# EAGLE design source_eagle (EAGLE 9.6.2)
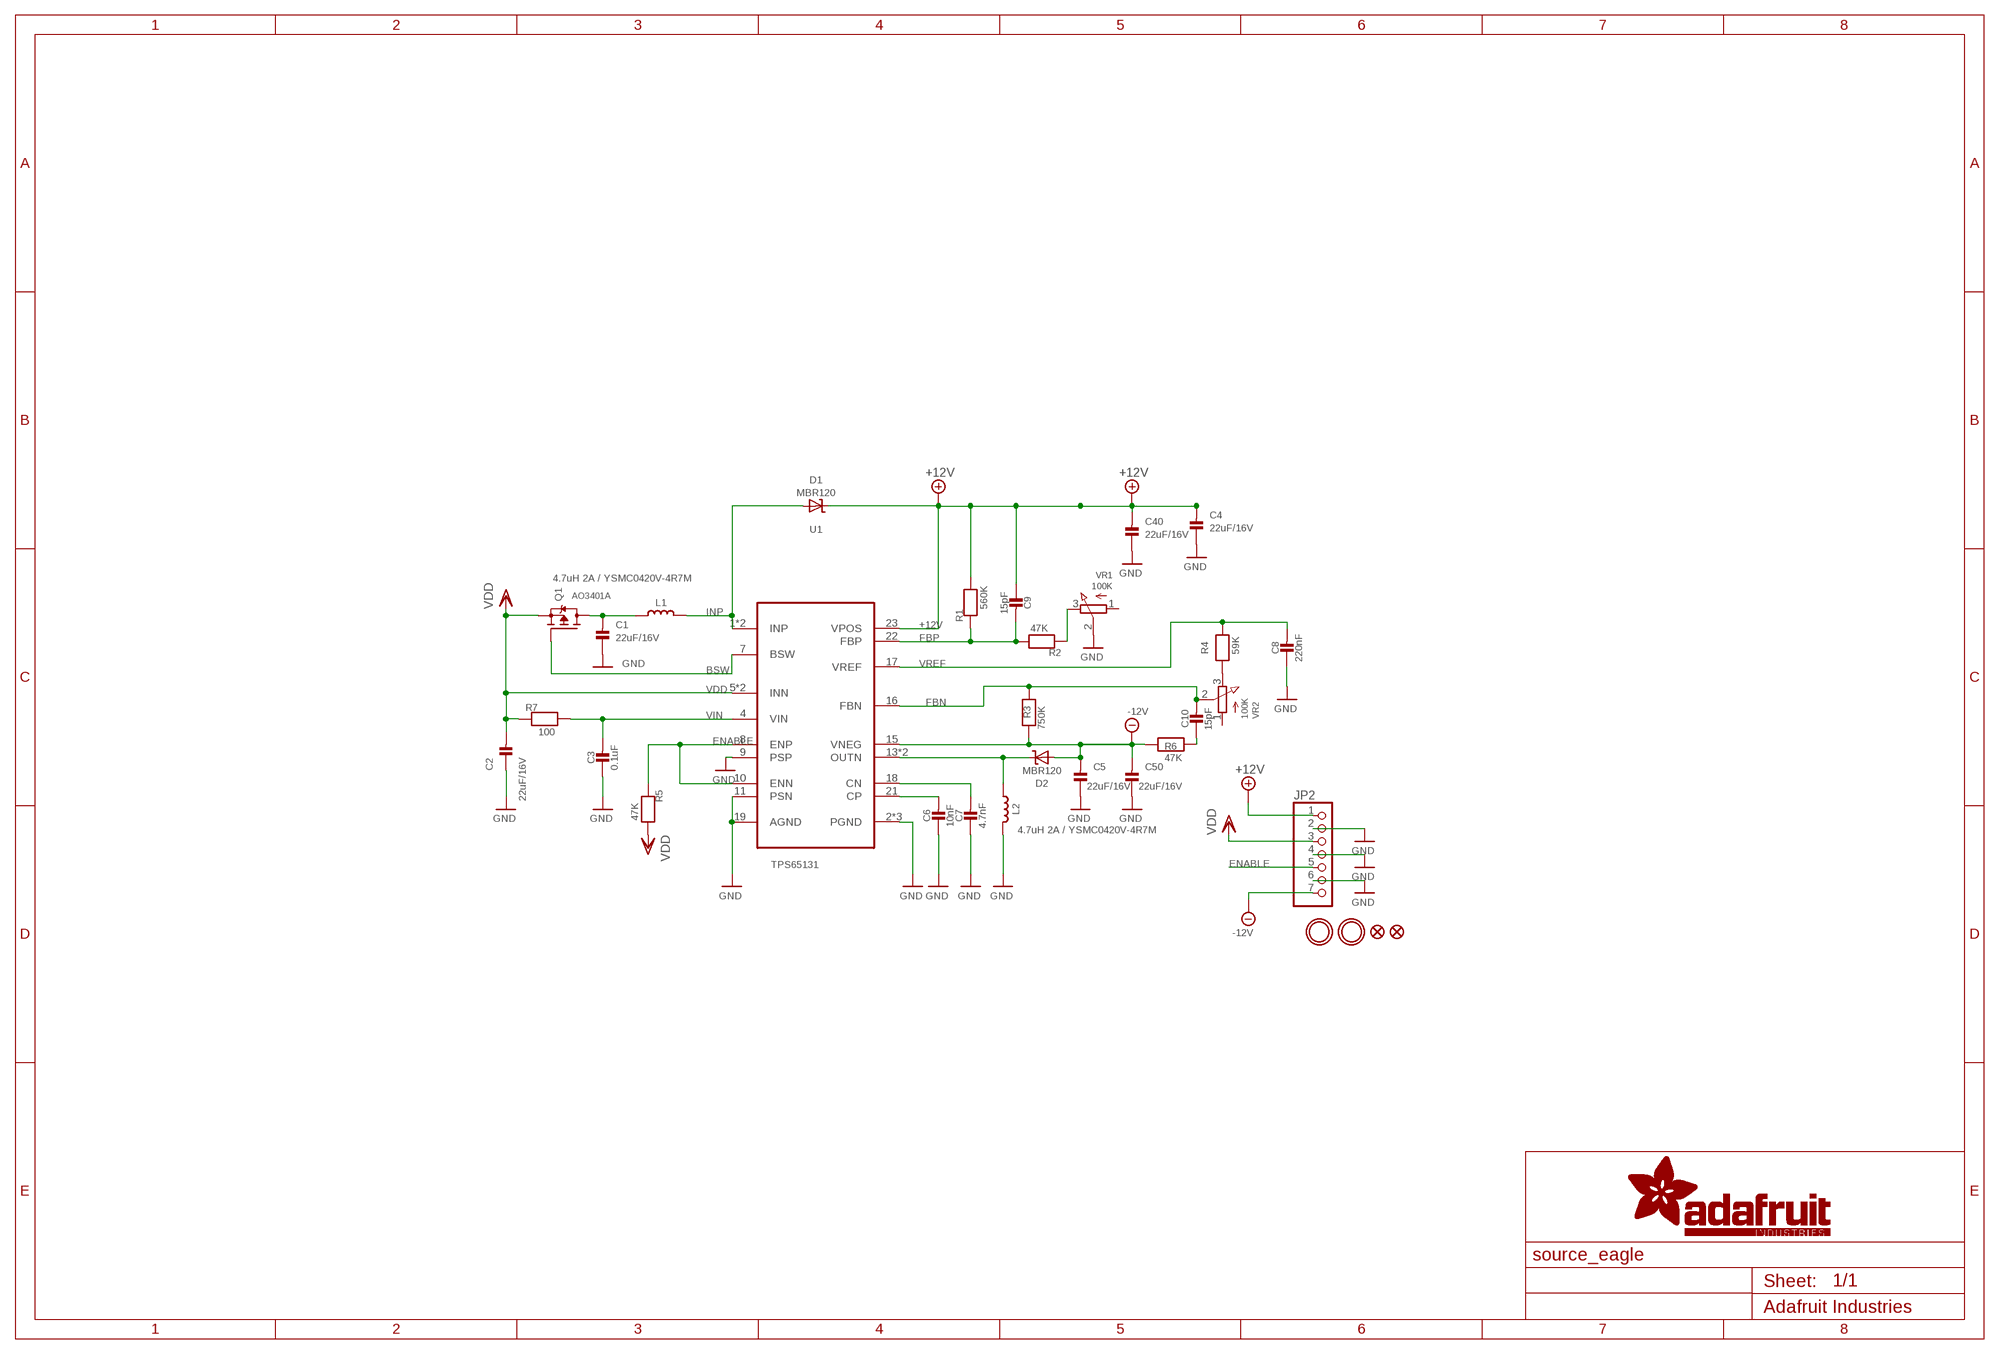
[diagram p0: schematic, sheet 1]

## Parts
C1  22uF/16V  CAP_CERAMIC0805-NOOUTLINE  [0805-NO]
C2  22uF/16V  CAP_CERAMIC0805-NOOUTLINE  [0805-NO]
C3  0.1uF  CAP_CERAMIC0603_NO  [0603-NO]
C4  22uF/16V  CAP_CERAMIC0805-NOOUTLINE  [0805-NO]
C5  22uF/16V  CAP_CERAMIC0805-NOOUTLINE  [0805-NO]
C6  10nF  CAP_CERAMIC0603_NO  [0603-NO]
C7  4.7nF  CAP_CERAMIC0603_NO  [0603-NO]
C8  220nF  CAP_CERAMIC0603_NO  [0603-NO]
C9  15pF  CAP_CERAMIC0603_NO  [0603-NO]
C10  15pF  CAP_CERAMIC0603_NO  [0603-NO]
C40  22uF/16V  CAP_CERAMIC0805-NOOUTLINE  [0805-NO]
C50  22uF/16V  CAP_CERAMIC0805-NOOUTLINE  [0805-NO]
D1  MBR120  DIODE-SCHOTTKYSOD-123FL  [SOD-123FL]
D2  MBR120  DIODE-SCHOTTKYSOD-123FL  [SOD-123FL]
FID1  FIDUCIAL_0.5MM  [FIDUCIAL_0.5MM]
FID2  FIDUCIAL_0.5MM  [FIDUCIAL_0.5MM]
JP2  HEADER-1X7THICKER  [1X07_ROUND_76]
L1  4.7uH 2A / YSMC0420V-4R7M  INDUCTORNR401  [INDUCTOR_4X4MM_NR401]
L2  4.7uH 2A / YSMC0420V-4R7M  INDUCTORNR401  [INDUCTOR_4X4MM_NR401]
Q1  AO3401A  MOSFET-PWIDE  [SOT23-WIDE]
R1  560K  RESISTOR_0603_NOOUT  [0603-NO]
R2  47K  RESISTOR_0603_NOOUT  [0603-NO]
R3  750K  RESISTOR_0603_NOOUT  [0603-NO]
R4  59K  RESISTOR_0603_NOOUT  [0603-NO]
R5  47K  RESISTOR_0603_NOOUT  [0603-NO]
R6  47K  RESISTOR_0603_NOOUT  [0603-NO]
R7  100  RESISTOR_0603_NOOUT  [0603-NO]
U1  TPS65131  TPS6513X  [QFN24_4MM]
U$1  MOUNTINGHOLE2.5  [MOUNTINGHOLE_2.5_PLATED]
U$2  MOUNTINGHOLE2.5  [MOUNTINGHOLE_2.5_PLATED]
VR1  100K  TRIMPOTTC33X-2  [TRIMPOT_BOURNS_TC33X-2]
VR2  100K  TRIMPOTTC33X-2  [TRIMPOT_BOURNS_TC33X-2]

## Nets
+12V: C4.2 C9.1 C40.2 D1.C JP2.1 R1.2 U1.23(VPOS)
-12V: C5.2 C50.2 D2.A JP2.7 R3.1 R6.1 U1.15(VNEG)
BSW: Q1.1(G) U1.7(BSW)
ENABLE: JP2.5 R5.1 U1.8(ENP) U1.10(ENN)
FBN: C10.2 R3.2 U1.16(FBN) VR2.2(S)
FBP: C9.2 R1.1 R2.2 U1.22(FBP)
GND: C1.1 C2.1 C3.1 C4.1 C5.1 C6.1 C7.1 C8.1 C40.1 C50.1 JP2.2 JP2.4 JP2.6 L2.P$2 U1.2(PGND) U1.3(PGND) U1.9(PSP) U1.11(PSN) U1.19(AGND) U1.25(PGND) VR1.2(S)
INP: D1.A L1.P$2 U1.1(INP) U1.24(INP)
N$1: C6.2 U1.21(CP)
N$2: C1.2 L1.P$1 Q1.3(D)
N$3: R2.1 VR1.3(E)
N$4: R4.1 VR2.3(E)
N$5: C10.1 R6.2
N$17: C7.2 U1.18(CN)
OUTN: D2.C L2.P$1 U1.13(OUTN) U1.14(OUTN)
VDD: C2.2 JP2.3 Q1.2(S) R5.2 R7.1 U1.5(INN) U1.6(INN)
VIN: C3.2 R7.2 U1.4(VIN)
VREF: C8.2 R4.2 U1.17(VREF)
Unconnected: VR1.1(A) VR2.1(A)

## Library data of the parts
C1-C10 C40 C50 = microbuilder:CAP_CERAMIC: Ceramic Capacitors For new designs, use the packages preceded by an '_' character since they are more reliable: The following footprints should be used on most boards: _0402 - Standard footprint for regular board layouts _0603 - Standard footprint for regular board layouts _0805 - Standard footprint for regular board layouts _1206 - Standard footprint for regular board layouts For extremely tight-pitch boards where space is at a premium, the following 'micro-pitch' footprints can be used (smaller pads, no silkscreen outline, etc.): _0402MP - Micro-pitch footprint for very dense/compact boards _0603MP - Micro-pitch footprint for very dense/compact boards _0805MP - Micro-pitch footprint for very dense/compact boards _1206MP - Micro-pitch footprint for very dense/compact boards
D1 D2 = microbuilder:DIODE-SCHOTTKY
FID1 FID2 = microbuilder:FIDUCIAL: Fiducial Alignment Points Various fiducial points for machine vision alignment.
JP2 = microbuilder:HEADER-1X7: PIN HEADER
L1 L2 = microbuilder:INDUCTOR: Inductors 0603: 10nH Ceramic Inductor - microwire antenna/RF (Digikey: 712-1434-2-ND) 0805: 560nH Ceramic Inductor - RF (Digikey: 553-1047-1-ND) 270nH Ceramic Inductor - Q = 40@250MHz, +-5%, 1 Ohm DC Resistance (Digikey: 535-10506-2-ND) 1007 (2518 Metric) SMT: 10µH 10% 250mOhm 820mA 1007 Inductor (Digikey: 587-2189-1-ND) 22µH 10% 500mOhm 580mA 1007 Inductor (Digikey: 587-2190-1-ND) 47µH 10% 950mOhm 420mA 1007 Inductor (Digikey: 587-2191-1-ND) 47µH 5% 100mOhm 1A 1008 Inductor (Digikey: 732-1816-1-ND) 5.0x5.0mm (Taiyo Yuden NR5040 Series) 6.8µH 20% 2.3A 64mOhm Inductor (Digikey: 587-2374-2-ND) 5.0x5.0mm (TDK VLC5045 Series) 4.7µH 20% 3.3A 34mOhm Inductor (Digikey: 445-6526-1-ND) 6.8µH 20% 2.7A 46mOhm Inductor (Digikey: 445-6527-1-ND) 6.0x6.0mm (TDK VLC6045 Series) 4.7µH 20% 3.8A 27mOhm Inductor (Digikey: 445-6538-2-ND) 6.8µH 20% 3A 41mOhm Inductor (Digikey: 445-6540-1-ND) 6.2µH 30% 2.2A 45mOhm Inductor (Digikey: SRR5028-6R2YCT-ND) - Not TDK VLC6045 but footprint should match 6.0x6.0mm (TDK SLF6045 Series) 6.8uH 30% 2A 33mOhm Inductor (Digikey: 445-4572-1-ND, Mouser: 810-SLF645T6R8N2R0PF) 6.0x6.0mm (Sumida CDRH5D28 Series) 6.2uH 30% 1.8A 45mOhm Inductor (Digikey: 308-1542-1-ND) Taiyo Yuden NR3015T2R2M - 2.2uH 20% 1.5A (Digikey: 587-1648-2-ND, Mouser: 963-NR3015T2R2M) - Used with TI TPS62172 CoilCraft RFID Transponder Coil - MA5532-AE (For use with AS3935 Lightning Sensor) Taiyo Yuden NRH2412T2R2MNGH - 2.2uH 20% 1AA (Digikey: 587-3443-1-ND) - Used with TI LM3671 Vishay IHLP 1.0uH Molded Inductor - 24mOhm DCR, 5A, +/-20%, -55°C-125°C (Digikey: 541-1319-1-ND)
Q1 = microbuilder:MOSFET-P: P-Channel Mosfet LEGEND VDS: Voltage Drain-Source ID: Drain Current RDS(ON): Drain-Source On-State Resistance VGS(TH): Gate-Source Threshold Voltage CISS: Drain-Source Input Capacitance SOT-23 Name VDS ID RDS(ON) VGS(TH) CISS Order Number IRLML5103 30V 760mA 600 mOhm -- 75pF @ 25V Digikey: IRLML5103PBFCT-ND IRLML6401 12V 4.3A 50 mOhm 950mV @ 250µA 830pF @ 10V Digikey: IRLML6401PBFTR-ND NTR0202PL 20V 400mA 800 mOhm 2.3V @ 250uA 70pF @ 5V Digikey: NTR0202PLT1GOSTR-ND NTR4101PT1G 20V 1.8A 85 mOhm 1.2V @ 250uA 675pF @ 10V Digikey: NTR4101PT1GOSCT-ND DMP2004K 20V 600mA 900 mOhm 1V @ 250uA 175pF @ 16V Digikey: DMP2004KDICT-ND PMV65XP 20V 3.9A 76 mOhm 950mV @ 1mA 725pF @ 20V Digikey: 568-2358-2-ND TO-252 Name VDS ID RDS(ON) VGS(TH) CISS Order Number AOD417 30V 25A 34 mOhm 3V @ 250µA 920pF @ 15V Digikey: 785-1106-2-ND PowerPak Name VDS ID RDS(ON) VGS(TH) CISS Order Number AON7401 30V 12A 14 mOhm 3V @ 250µA 2600pF @ 15V Digikey: 785-1302-1-ND
R1-R7 = microbuilder:RESISTOR: Resistors For new designs, use the packages preceded by an '_' character since they are more reliable: The following footprints should be used on most boards: _0402 - Standard footprint for regular board layouts _0603 - Standard footprint for regular board layouts _0805 - Standard footprint for regular board layouts _1206 - Standard footprint for regular board layouts For extremely tight-pitch boards where space is at a premium, the following 'micro-pitch' footprints can be used (smaller pads, no silkscreen outline, etc.): _0402MP - Micro-pitch footprint for very dense/compact boards _0603MP - Micro-pitch footprint for very dense/compact boards _0805MP - Micro-pitch footprint for very dense/compact boards _1206MP - Micro-pitch footprint for very dense/compact boards
U1 = adafruit_power:TPS6513X: None; MANUFACTURER: Texas Instruments; PACKAGE: QFN50P400X400X100-25N
U$1 U$2 = adafruit_electromech:MOUNTINGHOLE: Mounting Hole For #2 screws (0.086"/2.18mm width, 0.094"/2.4mm hole) use 2.5mm; BOM: EXCLUDE
VR1 VR2 = microbuilder:TRIMPOT: 3-Pin SMT Trimpots Bourns TC33 (X-2) Series 1K - Digikey: TC33X-102ECT-ND 10K - Digikey: TC33X-2-103E 100K - Digikey: TC33X-104ECT-ND Bourns 3303 (W) Series 3mm 10K Single Turn - Digikey: 3303W-103ETR-ND 3mm 100K Single Turn - Digikey: 3303X-104ETR-ND; ROT: 0

## Net classes
3 HIGHPOWER: width 0.254 mm, drill 0.483 mm

## Board
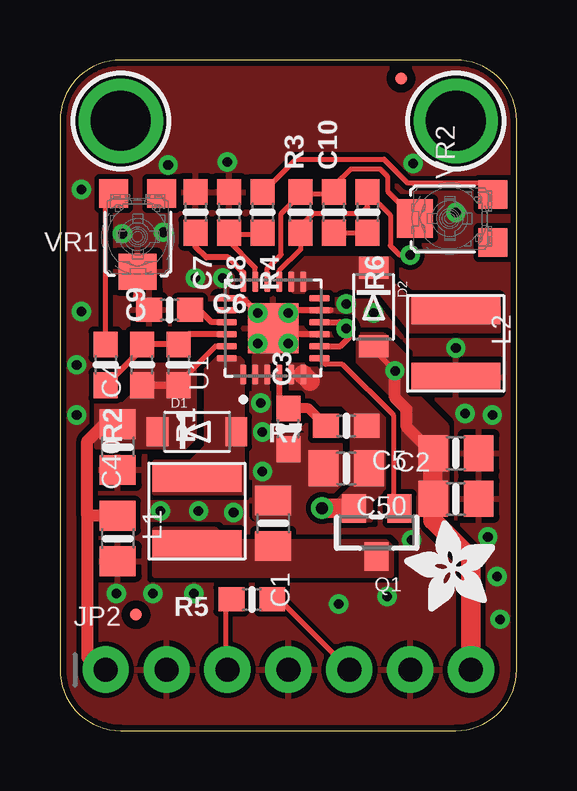
[diagram p1: board, top side]
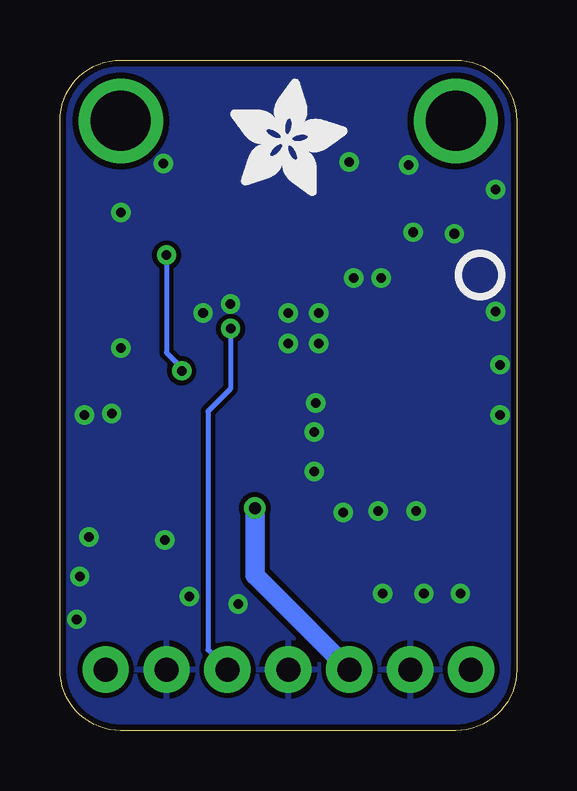
[diagram p2: board, bottom side, seen from below]

Size 19.05 x 27.94 mm. Coordinates in mm from the lower left corner, seen from the top.
Outline: 0,25.4 0,2.54 arc90 2.54,0 16.51,0 arc90 19.05,2.54 19.05,25.4 arc90 16.51,27.94 2.54,27.94 arc90 0,25.4
Copper layers (1*16): Top 0.035mm / dielectric 1.5mm / Bottom 0.035mm
Design rules "adafruit 7-7": minimum track width 7mil, minimum drill 15.5mil, track to track 8mil, track to pad 7mil, pad to pad 7mil, via to via 7mil, smd to smd 7mil, copper to edge 10mil, drill to drill 8mil, minimum pad ring 10mil, minimum via ring 8mil, stop-mask expansion 2mil, vias tented up to drill 20mil, thermal gap 10mil

### Footprints (pad centres in the part's own frame; a part is rotated, then mirrored left to right if it is on the bottom)
0805-NO = smd 1.24 x 1.5: 1 -0.95,0; 2 0.95,0
0603-NO = smd 1.075 x 1: 1 -0.85,0; 2 0.85,0
SOD-123FL = smd 0.91 x 1.22: A 1.637,0; C -1.637,0
FIDUCIAL_0.5MM = smd 0.5 x 0.5: 1 0,0
1X07_ROUND_76 = drill 1 pad 1.93: 1 -7.62,0; 2 -5.08,0; 3 -2.54,0; 4 0,0; 5 2.54,0; 6 5.08,0; 7 7.62,0
INDUCTOR_4X4MM_NR401 = smd 1.2 x 3.7: P$1 -1.4,0; P$2 1.4,0
SOT23-WIDE = smd 1 x 1.2: 1 -0.95,-1; 2 0.95,-1; 3 0,1
QFN24_4MM = smd 0.84 x 0.26: 1 -1.935,1.25; 2 -1.935,0.75; 3 -1.935,0.25; 4 -1.935,-0.25; 5 -1.935,-0.75; 6 -1.935,-1.25; 13 1.935,-1.25; 14 1.935,-0.75; 15 1.935,-0.25; 16 1.935,0.25; 17 1.935,0.75; 18 1.935,1.25 | smd 0.26 x 0.84: 7 -1.25,-1.935; 8 -0.75,-1.935; 9 -0.25,-1.935; 10 0.25,-1.935; 11 0.75,-1.935; 12 1.25,-1.935; 19 1.25,1.935; 20 0.75,1.935; 21 0.25,1.935; 22 -0.25,1.935; 23 -0.75,1.935; 24 -1.25,1.935 | smd 2.1 x 2.1: 25 0,0
MOUNTINGHOLE_2.5_PLATED = drill 2.5 pad 3.2: P$1 0,0
TRIMPOT_BOURNS_TC33X-2 = smd 1.2 x 1.2: 1 -1,-1.8; 3 1,-1.8 | smd 1.6 x 1.5: 2 0,1.45

### Placement (x,y rotation side)
C1  8.89,8.64 270 top
C2  11.94,10.92 0 top
C3  9.53,12.57 90 top
C4  2.41,11.81 90 top
C5  16.51,11.56 180 top
C6  4.57,17.53 0 top
C7  5.65,21.59 270 top
C8  7.05,21.59 270 top
C9  3.43,15.24 90 top
C10  11.43,21.59 90 top
C40  2.41,8 90 top
C50  16.51,9.65 180 top
D1  5.71,12.45 0 top
D2  13.08,17.65 270 top
FID1  3.17,4.83 0 top
FID2  14.22,27.18 0 top
JP2  9.53,2.54 0 top
L1  5.71,9.14 90 top
L2  16.51,16.13 270 top
PLABEL0  [PLABEL0]  1.91,4.19 0 top
PLABEL1  [PLABEL1]  4.45,0.89 0 top
PLABEL2  [PLABEL2]  6.86,4.19 0 top
PLABEL3  [PLABEL3]  9.53,0.89 0 top
PLABEL4  [PLABEL4]  12.06,4.32 0 top
PLABEL5  [PLABEL5]  14.61,0.89 0 top
PLABEL6  [PLABEL6]  17.14,4.19 0 top
PLABEL7  [PLABEL7]  9.53,25.4 0 top
PLABEL8  [PLABEL8]  1.02,20.7 90 top
PLABEL9  [PLABEL9]  16.51,18.99 0 top
PLABEL10  [PLABEL10]  8.89,20.45 0 bottom
PLABEL11  [PLABEL11]  9.53,10.54 0 bottom
Q1  13.21,8.26 180 top
R1  4.95,15.24 270 top
R2  1.91,15.24 270 top
R3  10.03,21.59 90 top
R4  8.45,21.59 270 top
R5  8,5.46 180 top
R6  12.83,21.59 270 top
R7  11.94,12.7 180 top
U1  8.89,16.76 90 top
U$1  2.54,25.4 0 top
U$2  16.51,25.4 0 top
U$3  [ADAFRUIT_3.5MM]  18.16,4.95 90 top
U$4  [ADAFRUIT_5MM]  11.94,22.29 0 bottom
U$5  [PCBFEAT-REV-040]  1.52,18.99 0 bottom
VR1  3.24,20.57 180 top
VR2  16.26,21.34 90 top

### Tracks (layer width: path | path; a pad name or v marks a point on that pad's centre or on a via)
+12V
  Top 0.203: U1.23 6.49,16.01 4.95,14.48 R1.2
  Top 0.305: R1.2 C9.1
  Top 0.508: C40.2 1.14,8.95 | 1.14,8.95 1.14,3.05 1.65,2.54 JP2.1 | 1.14,8.95 1.14,12.06 1.84,12.76 C4.2
  pour Top (no thermals): 5.59,15.24 5.59,12.19 5.21,11.81 1.52,11.81 1.52,13.59 2.67,13.59 3.17,14.1 3.17,14.99 3.43,15.24
-12V  (via drill 0.39)
  Top 0.203: U1.15 9.14,19.15 10.03,20.04 R3.1 10.03,21.02 10.57,21.56 12.57,21.56 12.83,21.81 R6.1 13.78,21.49 13.78,20.21 14.18,19.81 v14.61,19.81 | v13.97,14.99 v13.98,14.99 13.08,15.89 D2.A
  Top 0.508: C5.2 14.46,12.66 14.46,13.38 13.97,13.87 v13.97,14.99
  Top 0.813: JP2.7 17.14,7.18 15.56,8.76 C50.2 C5.2
  Bottom 0.203: v14.61,19.81 14.61,15.75 13.97,15.11 v13.97,14.99
  pour Top (no thermals): 12.45,16.51 13.46,16.51 14.73,15.24 14.73,14.1 16.13,12.7 16.13,9.02 14.35,9.02 14.35,13.46 12.45,15.37
BSW
  Top 0.203: U1.7 11.08,15.26 11.79,15.26 13.9,13.15 13.9,9.51 Q1.1
ENABLE  (via drill 0.39)
  Top 0.203: 11.67,17.01 v11.93,16.75 | R5.1 9.14,5.46 JP2.5
  Top 0.254: U1.10 11.67,17.01 12.05,17.01 12.05,16.36 11.7,16.01 U1.8
  Bottom 0.203: v11.93,16.75 11.93,14.25 12.88,13.3 12.88,3.36 JP2.5
FBN
  Top 0.203: U1.16 8.64,19.25 9.22,19.83 9.22,21.54 10.03,22.35 | R3.2 10.03,22.35 | VR2.2 13.66,22.48 13.66,23.09 13.36,23.39 12.13,23.39 11.43,22.69 C10.2 11.34,22.35 10.03,22.35
FBP
  Top 0.254: R2.2 3.43,15.91 C9.2 R1.1 5.38,16.51 U1.22
GND  (via drill 0.4)
  Top 0.254: U1.19 7.36,18.01 7.4,17.97 7.68,17.97 U1.25 9.02,16.89 | 9.02,16.89 9.64,17.51 U1.11 11.29,17.51 | U1.9 9.39,16.51 9.02,16.89
  Top 0.406: C6.1 3.72,17.61 3.26,18.08 3.26,19.11 VR1.2
  other vias: 8.45,10.79 8.38,13.65 8.45,12.45 7.24,9.08 5.78,9.14 4.19,9.14 16.89,13.21 18.03,13.14 17.84,8.06 18.22,6.41 18.35,4.64 14.67,7.94 16.51,21.59 11.94,17.78 13.08,17.4 16.51,15.94 9.53,17.4 8.26,16.13 8.26,17.4 9.53,16.13 6.79,18.86 5.65,18.86 4.32,20.76 2.6,20.7 0.89,17.46 0.7,13.14 0.7,15.24 0.89,22.54 4.51,23.56 6.99,23.69 14.73,23.62 11.62,5.27 2.35,5.71 3.87,5.71 5.59,5.71 13.65,5.59
  pour Top (no thermals): 8.13,8.89 8.13,15.75 8.64,15.75 8.64,12.83 8.89,12.57 8.89,12.32 11.43,12.32 11.68,12.06 11.68,10.29 10.16,8.76 8.26,8.76
  pour Top (rank 2): 0,27.94 19.05,27.94 19.05,0 0,0
  pour Bottom (rank 2): 0,27.94 19.05,27.94 19.05,0 0,0
INP
  pour Top (no thermals): 3.94,11.18 3.94,9.91 7.62,9.91 7.62,15.37 7.49,15.49 6.48,15.49 6.1,15.11 6.1,11.81 5.46,11.18
N$1
  Top 0.254: U1.21 6.32,17.01 5.8,17.53 C6.2
N$2
  pour Top (no thermals): 3.94,8.38 3.94,6.48 13.84,6.48 13.84,7.62 13.59,7.87 6.99,7.87 6.48,8.38
N$3
  Top 0.203: R2.1 1.91,22.04 VR1.3
N$4
  Top 0.203: R4.1 8.47,22.44 9.84,23.81 13.51,23.81 14.51,22.81 17.58,22.81 VR2.3
N$5
  Top 0.203: C10.1 R6.2
N$17
  Top 0.254: U1.18 7.64,19.08 7,19.71 6.11,19.71 5.65,20.17 C7.2
OUTN
  pour Top (no thermals): 9.65,18.41 9.65,19.68 13.84,19.68 13.84,18.67 14.86,17.65 18.29,17.65 18.29,16.64 14.66,16.64 13.34,18.29 9.78,18.29
VDD  (via drill 0.5)
  Top 0.203: R5.2 6.9,5.21 6.9,2.63 JP2.3
  Top 0.813: Q1.2 10.94,9.26 v10.92,9.27 | U1.6 10.15,14.83 10.43,14.55
  Bottom 0.813: v10.92,9.27 10.92,6.48 JP2.3
  pour Top (no thermals): 9.65,13.59 9.65,15.24 11.94,15.24 13.59,13.59 13.59,10.16 12.95,9.53 12.95,8.76 11.68,8.76 11.68,9.65 12.19,10.16 12.19,13.21 11.81,13.59
VIN
  Top 0.254: U1.4 9.14,13.81 C3.2
  Top 0.406: R7.2 10.37,13.42 C3.2
VREF
  Top 0.203: U1.17 8.14,19.29 7,20.43 7.11,20.43 7.11,20.61 7.07,20.66 7.13,20.66 | 7.13,20.66 C8.2 | R4.2 8.36,20.66 7.13,20.66

### Text on the board
Pinguin_tBackup: TPS65131 / Split Boost | +6>15V | -6>15V | V+ | Vin | EN | V- | GND | GND | GND
Pinguin_bBackup: TPS65131 | Dual output split / supply booster / Vin: 2.7~5.5V / Vout Pos:+6~15V / Vout Neg:-6~-15V / Max Iout: 150mA / (from each rail)